# Altium schematic sheet FK.SchDoc: ИЛ1429ТО1/1
size 410 x 297 mm; ApprovedBy: Стерхов В.Д.; CheckedBy: Стерхов В.Д.; Author: Сергеев Д.А.; CompanyName: ГК "СНАБЖЕНИЕ"; DrawnBy: Сергеев Д.А.; Engineer: Сергеев Д.А.; Organization: ГК "СНАБЖЕНИЕ"; DocumentNumber: ИЛ1429ТО1/1; Revision: 1; SheetNumber: 3; SheetTotal: 3
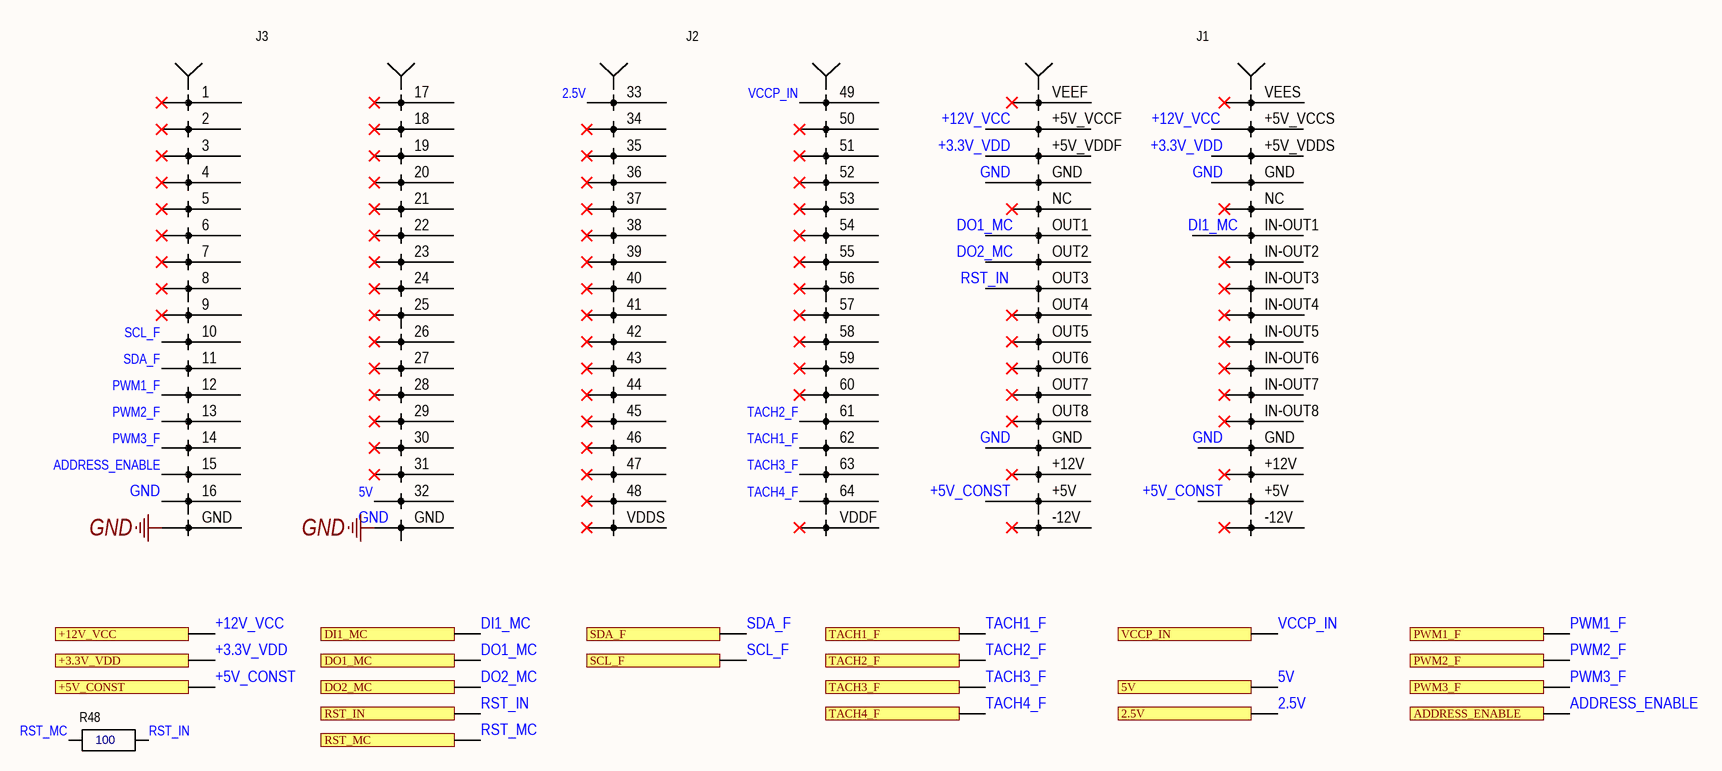
[diagram p0: FK.SchDoc]

## Parts
R48  100  [0805]
X4  FORMULA  [FORMULA]  (value not drawn)

## Ports
2.5V, 5V, +3.3V_VDD, +5V_CONST, +12V_VCC, ADDRESS_ENABLE, DI1_MC, DO1_MC, DO2_MC, PWM1_F, PWM2_F, PWM3_F, RST_IN, RST_MC, SCL_F, SDA_F, TACH1_F, TACH2_F, TACH3_F, TACH4_F, VCCP_IN

## Nets
GND: X4.16 X4.GND
2.5V: X4.33 ; port 2.5V
5V: X4.32 ; port 5V
+3.3V_VDD: X4.+5V_VDDF(VDDF) X4.+5V_VDDS(VDDS) ; port +3.3V_VDD
+5V_CONST: X4.+5V ; port +5V_CONST
+12V_VCC: X4.+5V_VCCF(VCCF) X4.+5V_VCCS(VCCS) ; port +12V_VCC
ADDRESS_ENABLE: X4.15 ; port ADDRESS_ENABLE
DI1_MC: X4.IN-OUT1 ; port DI1_MC
DO1_MC: X4.OUT1 ; port DO1_MC
DO2_MC: X4.OUT2 ; port DO2_MC
PWM1_F: X4.12 ; port PWM1_F
PWM2_F: X4.13 ; port PWM2_F
PWM3_F: X4.14 ; port PWM3_F
RST_IN: R48.2 X4.OUT3 ; port RST_IN
RST_MC: R48.1 ; port RST_MC
SCL_F: X4.10 ; port SCL_F
SDA_F: X4.11 ; port SDA_F
TACH1_F: X4.62 ; port TACH1_F
TACH2_F: X4.61 ; port TACH2_F
TACH3_F: X4.63 ; port TACH3_F
TACH4_F: X4.64 ; port TACH4_F
VCCP_IN: X4.49 ; port VCCP_IN

Not connected (* = marked no-connect by the designer): X4 1* 2* 3* 4* 5* 6* 7* 8* 9* 17* 18* 19* 20* 21* 22* 23* 24* 25* 26* 27* 28* 29* 30* 31* 34* 35* 36(4)* 37(5)* 38* 39* 40* 41* 42* 43* 44* 45* 46* 47* 48* 50* 51* 52* 53* 54* 55* 56* 57* 58* 59* 60* +12V* -12V* IN-OUT2* IN-OUT3* IN-OUT4* IN-OUT5* IN-OUT6* IN-OUT7* IN-OUT8* NC* OUT4* OUT5* OUT6* OUT7* OUT8* VDDF* VDDS* VEEF* VEES*

## Notes on the sheet
- Подп. и дата
- Инв. № дубл.
- Взам. инв. №
- Инв. № подл.
- Изм.
- Лист
- № докум.
- Подп.
- Дата
- Форма 2а ГОСТ 2.104-2006
- Копировал
- Формат А3
- (in symbol FORMULA) J3; J2; J1

## Library data of the parts
R48 = R0805 Yageo: ComponentHeigt: 0.6; Firme: Yageo; Leadform: SMD; Kind: Резистор; ClassName: *; ComponentWeigt: *; Component Link: *; Packaging: 0805; NN: *; Value: *